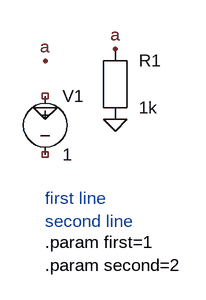
[diagram p0: schematic multiline_text.asc]
multiline_text.asc, the LTspice schematic file:
Version 4
SHEET 1 880 680
FLAG 0 112 a
FLAG 0 176 0
FLAG 96 96 a
FLAG 96 192 0
SYMBOL voltage 0 144 R0
SYMATTR InstName V1
SYMATTR Value 1
SYMBOL res 96 144 R0
SYMATTR InstName R1
SYMATTR Value 1k
TEXT 0 300 Left 2 ;first line\nsecond line
TEXT 0 360 Left 2 !.param first=1\n.param second=2

The netlist it stands for:
* multiline_text.asc
V1 NC_01 NC_02 1
R1 a 0 1k
* first line
* second line
.param first=1
.param second=2
.backanno
.end